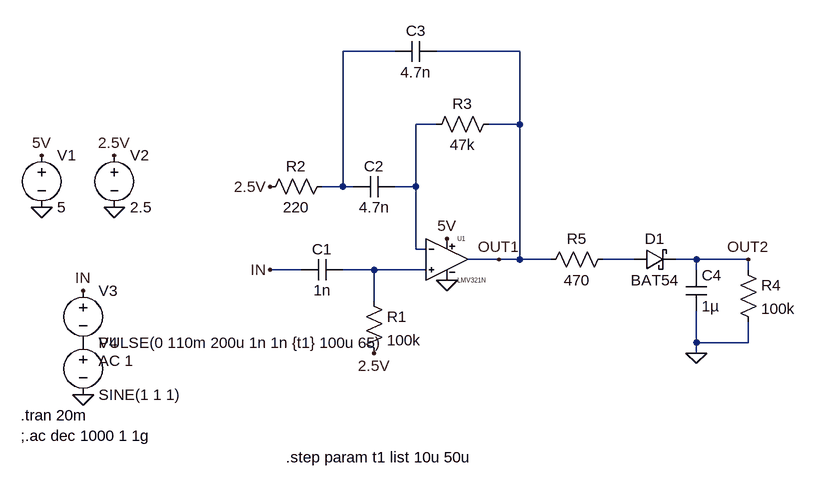
[diagram p0: schematic ir_proximity_sensor.asc]
ir_proximity_sensor.asc, the LTspice schematic file:
Version 4
SHEET 1 1036 680
WIRE 416 -112 336 -112
WIRE 608 -112 480 -112
WIRE 480 0 448 0
WIRE 608 0 608 -112
WIRE 608 0 560 0
WIRE 336 96 336 -112
WIRE 336 96 304 96
WIRE 352 96 336 96
WIRE 448 96 448 0
WIRE 448 96 416 96
WIRE 448 192 448 96
WIRE 464 192 448 192
WIRE 576 208 528 208
WIRE 608 208 608 0
WIRE 608 208 576 208
WIRE 656 208 608 208
WIRE 784 208 736 208
WIRE 880 208 848 208
WIRE 960 208 880 208
WIRE 272 224 224 224
WIRE 384 224 336 224
WIRE 464 224 384 224
WIRE 880 224 880 208
WIRE 960 224 960 208
WIRE 384 272 384 224
WIRE 880 336 880 288
WIRE 960 336 960 304
WIRE 960 336 880 336
WIRE 880 352 880 336
FLAG 496 240 0
FLAG 496 176 5V
FLAG -128 128 0
FLAG -16 128 0
FLAG -128 48 5V
FLAG -16 48 2.5V
FLAG 224 96 2.5V
FLAG 384 352 2.5V
FLAG 224 224 IN
FLAG 576 208 OUT1
FLAG 960 208 OUT2
FLAG -64 416 0
FLAG -64 256 IN
FLAG 880 352 0
SYMBOL cap 336 208 R90
WINDOW 0 0 32 VBottom 2
WINDOW 3 32 32 VTop 2
SYMATTR InstName C1
SYMATTR Value 1n
SYMBOL cap 416 80 R90
WINDOW 0 0 32 VBottom 2
WINDOW 3 32 32 VTop 2
SYMATTR InstName C2
SYMATTR Value 4.7n
SYMBOL cap 480 -128 R90
WINDOW 0 0 32 VBottom 2
WINDOW 3 32 32 VTop 2
SYMATTR InstName C3
SYMATTR Value 4.7n
SYMBOL res 368 256 R0
SYMATTR InstName R1
SYMATTR Value 100k
SYMBOL res 320 80 R90
WINDOW 0 0 56 VBottom 2
WINDOW 3 32 56 VTop 2
SYMATTR InstName R2
SYMATTR Value 220
SYMBOL res 576 -16 R90
WINDOW 0 0 56 VBottom 2
WINDOW 3 32 56 VTop 2
SYMATTR InstName R3
SYMATTR Value 47k
SYMBOL schottky 784 224 R270
WINDOW 0 32 32 VTop 2
WINDOW 3 0 32 VBottom 2
SYMATTR InstName D1
SYMATTR Value BAT54
SYMATTR Description Diode
SYMATTR Type diode
SYMBOL cap 864 224 R0
SYMATTR InstName C4
SYMATTR Value 1µ
SYMBOL res 944 208 R0
SYMATTR InstName R4
SYMATTR Value 100k
SYMBOL voltage -128 32 R0
WINDOW 123 0 0 Left 0
WINDOW 39 0 0 Left 0
SYMATTR InstName V1
SYMATTR Value 5
SYMBOL voltage -16 32 R0
WINDOW 123 0 0 Left 0
WINDOW 39 0 0 Left 0
SYMATTR InstName V2
SYMATTR Value 2.5
SYMBOL voltage -64 240 R0
WINDOW 123 24 124 Left 2
WINDOW 39 0 0 Left 0
SYMATTR Value2 AC 1
SYMATTR InstName V3
SYMATTR Value PULSE(0 110m 200u 1n 1n {t1} 100u 65)
SYMBOL voltage -64 320 R0
WINDOW 123 0 0 Left 0
WINDOW 39 0 0 Left 0
SYMATTR InstName V4
SYMATTR Value SINE(1 1 1)
SYMBOL res 752 192 R90
WINDOW 0 0 56 VBottom 2
WINDOW 3 32 56 VTop 2
SYMATTR InstName R5
SYMATTR Value 470
SYMBOL LMV321N 496 144 R0
SYMATTR InstName U1
TEXT -160 448 Left 2 !.tran 20m\n;.ac dec 1000 1 1g
TEXT 248 512 Left 2 !.step param t1 list 10u 50u

The netlist it stands for:
* ir_proximity_sensor.asc
C1 N004 IN 1n
C2 N002 N001 4.7n
C3 OUT1 N001 4.7n
R1 N004 2.5V 100k
R2 N001 2.5V 220
R3 OUT1 N002 47k
D1 N003 OUT2 BAT54
C4 OUT2 0 1µ
R4 OUT2 0 100k
V1 5V 0 5
V2 2.5V 0 2.5
V3 IN P001 PULSE(0 110m 200u 1n 1n {t1} 100u 65) AC 1
V4 P001 0 SINE(1 1 1)
R5 N003 OUT1 470
XU1 N004 N002 5V 0 OUT1 LMV321N  ; pins IN+ IN- VCC VEE OUT
.model D D
.lib standard.dio
.tran 20m
;.ac dec 1000 1 1g
.step param t1 list 10u 50u
.lib LMV321N.lib
.backanno
.end